# Altium schematic sheet Status LEDs.SchDoc
size A; SheetNumber: 2; SheetTotal: 3
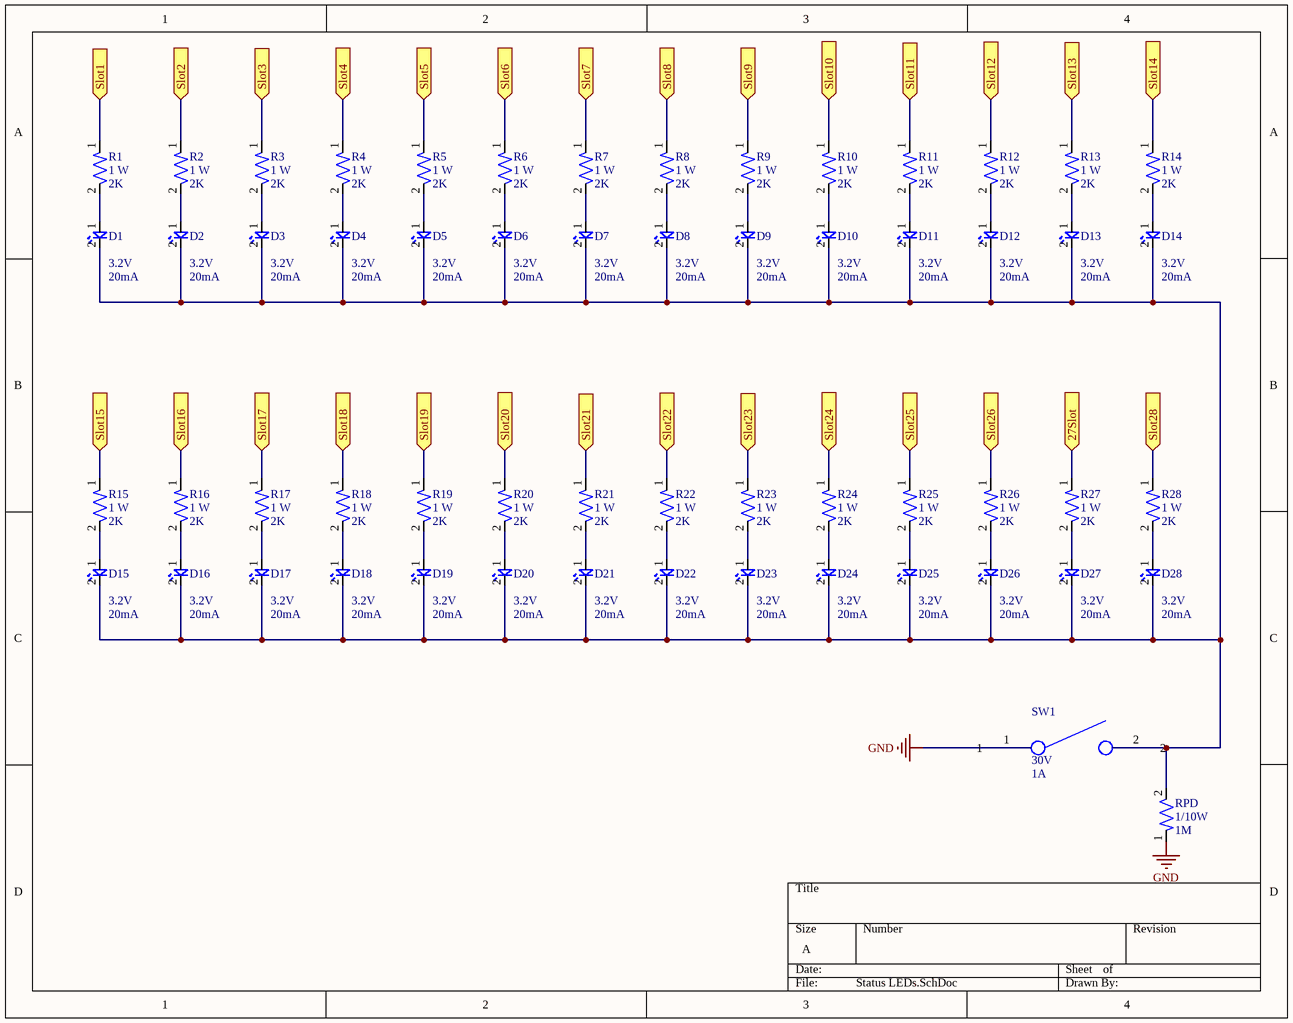
[diagram p0: Status LEDs.SchDoc]

## Parts
D1  Voltage: 3.2V  Current: 20mA  [WL-SMCW_0603]  (hidden comment: 150060GS75000)
D2  Voltage: 3.2V  Current: 20mA  [WL-SMCW_0603]  (hidden comment: 150060GS75000)
D3  Voltage: 3.2V  Current: 20mA  [WL-SMCW_0603]  (hidden comment: 150060GS75000)
D4  Voltage: 3.2V  Current: 20mA  [WL-SMCW_0603]  (hidden comment: 150060GS75000)
D5  Voltage: 3.2V  Current: 20mA  [WL-SMCW_0603]  (hidden comment: 150060GS75000)
D6  Voltage: 3.2V  Current: 20mA  [WL-SMCW_0603]  (hidden comment: 150060GS75000)
D7  Voltage: 3.2V  Current: 20mA  [WL-SMCW_0603]  (hidden comment: 150060GS75000)
D8  Voltage: 3.2V  Current: 20mA  [WL-SMCW_0603]  (hidden comment: 150060GS75000)
D9  Voltage: 3.2V  Current: 20mA  [WL-SMCW_0603]  (hidden comment: 150060GS75000)
D10  Voltage: 3.2V  Current: 20mA  [WL-SMCW_0603]  (hidden comment: 150060GS75000)
D11  Voltage: 3.2V  Current: 20mA  [WL-SMCW_0603]  (hidden comment: 150060GS75000)
D12  Voltage: 3.2V  Current: 20mA  [WL-SMCW_0603]  (hidden comment: 150060GS75000)
D13  Voltage: 3.2V  Current: 20mA  [WL-SMCW_0603]  (hidden comment: 150060GS75000)
D14  Voltage: 3.2V  Current: 20mA  [WL-SMCW_0603]  (hidden comment: 150060GS75000)
D15  Voltage: 3.2V  Current: 20mA  [WL-SMCW_0603]  (hidden comment: 150060GS75000)
D16  Voltage: 3.2V  Current: 20mA  [WL-SMCW_0603]  (hidden comment: 150060GS75000)
D17  Voltage: 3.2V  Current: 20mA  [WL-SMCW_0603]  (hidden comment: 150060GS75000)
D18  Voltage: 3.2V  Current: 20mA  [WL-SMCW_0603]  (hidden comment: 150060GS75000)
D19  Voltage: 3.2V  Current: 20mA  [WL-SMCW_0603]  (hidden comment: 150060GS75000)
D20  Voltage: 3.2V  Current: 20mA  [WL-SMCW_0603]  (hidden comment: 150060GS75000)
D21  Voltage: 3.2V  Current: 20mA  [WL-SMCW_0603]  (hidden comment: 150060GS75000)
D22  Voltage: 3.2V  Current: 20mA  [WL-SMCW_0603]  (hidden comment: 150060GS75000)
D23  Voltage: 3.2V  Current: 20mA  [WL-SMCW_0603]  (hidden comment: 150060GS75000)
D24  Voltage: 3.2V  Current: 20mA  [WL-SMCW_0603]  (hidden comment: 150060GS75000)
D25  Voltage: 3.2V  Current: 20mA  [WL-SMCW_0603]  (hidden comment: 150060GS75000)
D26  Voltage: 3.2V  Current: 20mA  [WL-SMCW_0603]  (hidden comment: 150060GS75000)
D27  Voltage: 3.2V  Current: 20mA  [WL-SMCW_0603]  (hidden comment: 150060GS75000)
D28  Voltage: 3.2V  Current: 20mA  [WL-SMCW_0603]  (hidden comment: 150060GS75000)
R1  Wattage: 1 W  Resistance: 2K  [RES-0805]  (hidden comment: RA73F2A2K0BTD)
R2  Wattage: 1 W  Resistance: 2K  [RES-0805]  (hidden comment: RA73F2A2K0BTD)
R3  Wattage: 1 W  Resistance: 2K  [RES-0805]  (hidden comment: RA73F2A2K0BTD)
R4  Wattage: 1 W  Resistance: 2K  [RES-0805]  (hidden comment: RA73F2A2K0BTD)
R5  Wattage: 1 W  Resistance: 2K  [RES-0805]  (hidden comment: RA73F2A2K0BTD)
R6  Wattage: 1 W  Resistance: 2K  [RES-0805]  (hidden comment: RA73F2A2K0BTD)
R7  Wattage: 1 W  Resistance: 2K  [RES-0805]  (hidden comment: RA73F2A2K0BTD)
R8  Wattage: 1 W  Resistance: 2K  [RES-0805]  (hidden comment: RA73F2A2K0BTD)
R9  Wattage: 1 W  Resistance: 2K  [RES-0805]  (hidden comment: RA73F2A2K0BTD)
R10  Wattage: 1 W  Resistance: 2K  [RES-0805]  (hidden comment: RA73F2A2K0BTD)
R11  Wattage: 1 W  Resistance: 2K  [RES-0805]  (hidden comment: RA73F2A2K0BTD)
R12  Wattage: 1 W  Resistance: 2K  [RES-0805]  (hidden comment: RA73F2A2K0BTD)
R13  Wattage: 1 W  Resistance: 2K  [RES-0805]  (hidden comment: RA73F2A2K0BTD)
R14  Wattage: 1 W  Resistance: 2K  [RES-0805]  (hidden comment: RA73F2A2K0BTD)
R15  Wattage: 1 W  Resistance: 2K  [RES-0805]  (hidden comment: RA73F2A2K0BTD)
R16  Wattage: 1 W  Resistance: 2K  [RES-0805]  (hidden comment: RA73F2A2K0BTD)
R17  Wattage: 1 W  Resistance: 2K  [RES-0805]  (hidden comment: RA73F2A2K0BTD)
R18  Wattage: 1 W  Resistance: 2K  [RES-0805]  (hidden comment: RA73F2A2K0BTD)
R19  Wattage: 1 W  Resistance: 2K  [RES-0805]  (hidden comment: RA73F2A2K0BTD)
R20  Wattage: 1 W  Resistance: 2K  [RES-0805]  (hidden comment: RA73F2A2K0BTD)
R21  Wattage: 1 W  Resistance: 2K  [RES-0805]  (hidden comment: RA73F2A2K0BTD)
R22  Wattage: 1 W  Resistance: 2K  [RES-0805]  (hidden comment: RA73F2A2K0BTD)
R23  Wattage: 1 W  Resistance: 2K  [RES-0805]  (hidden comment: RA73F2A2K0BTD)
R24  Wattage: 1 W  Resistance: 2K  [RES-0805]  (hidden comment: RA73F2A2K0BTD)
R25  Wattage: 1 W  Resistance: 2K  [RES-0805]  (hidden comment: RA73F2A2K0BTD)
R26  Wattage: 1 W  Resistance: 2K  [RES-0805]  (hidden comment: RA73F2A2K0BTD)
R27  Wattage: 1 W  Resistance: 2K  [RES-0805]  (hidden comment: RA73F2A2K0BTD)
R28  Wattage: 1 W  Resistance: 2K  [RES-0805]  (hidden comment: RA73F2A2K0BTD)
RPD  Wattage: 1/10W  Resistance: 1M  [RES-0603]  (hidden comment: RES 0603)
SW1  Voltage: 30V  Current: 1A  [BUTTON-0002]  (hidden comment: GPTS203211B)

## Ports
27Slot (in, see Power Distribution[4C]), Slot1 (in, see Power Distribution[1A]), Slot2 (in, see Power Distribution[1A]), Slot3 (in, see Power Distribution[1A]), Slot4 (in, see Power Distribution[2A]), Slot5 (in, see Power Distribution[2A]), Slot6 (in, see Power Distribution[2A]), Slot7 (in, see Power Distribution[2A]), Slot8 (in, see Power Distribution[3A]), Slot9 (in, see Power Distribution[3A]), Slot10 (in, see Power Distribution[3A]), Slot11 (in, see Power Distribution[3A]), Slot12 (in, see Power Distribution[4A]), Slot13 (in, see Power Distribution[4A]), Slot14 (in, see Power Distribution[4A]), Slot15 (in, see Power Distribution[1C]), Slot16 (in, see Power Distribution[1C]), Slot17 (in, see Power Distribution[1C]), Slot18 (in, see Power Distribution[2C]), Slot19 (in, see Power Distribution[2C]), Slot20 (in, see Power Distribution[2C]), Slot21 (in, see Power Distribution[2C]), Slot22 (in, see Power Distribution[3C]), Slot23 (in, see Power Distribution[3C]), Slot24 (in, see Power Distribution[3C]), Slot25 (in, see Power Distribution[3C]), Slot26 (in, see Power Distribution[4C]), Slot28 (in, see Power Distribution[4C])

## Nets
GND: RPD.1 SW1.1
27Slot: R27.1 ; port 27Slot
Slot1: R1.1 ; port Slot1
Slot2: R2.1 ; port Slot2
Slot3: R3.1 ; port Slot3
Slot4: R4.1 ; port Slot4
Slot5: R5.1 ; port Slot5
Slot6: R6.1 ; port Slot6
Slot7: R7.1 ; port Slot7
Slot8: R8.1 ; port Slot8
Slot9: R9.1 ; port Slot9
Slot10: R10.1 ; port Slot10
Slot11: R11.1 ; port Slot11
Slot12: R12.1 ; port Slot12
Slot13: R13.1 ; port Slot13
Slot14: R14.1 ; port Slot14
Slot15: R15.1 ; port Slot15
Slot16: R16.1 ; port Slot16
Slot17: R17.1 ; port Slot17
Slot18: R18.1 ; port Slot18
Slot19: R19.1 ; port Slot19
Slot20: R20.1 ; port Slot20
Slot21: R21.1 ; port Slot21
Slot22: R22.1 ; port Slot22
Slot23: R23.1 ; port Slot23
Slot24: R24.1 ; port Slot24
Slot25: R25.1 ; port Slot25
Slot26: R26.1 ; port Slot26
Slot28: R28.1 ; port Slot28
NetD1_1: D1.1 R1.2
NetD1_2: D1.2 D2.2 D3.2 D4.2 D5.2 D6.2 D7.2 D8.2 D9.2 D10.2 D11.2 D12.2 D13.2 D14.2 D15.2 D16.2 D17.2 D18.2 D19.2 D20.2 D21.2 D22.2 D23.2 D24.2 D25.2 D26.2 D27.2 D28.2 RPD.2 SW1.2
NetD2_1: D2.1 R2.2
NetD3_1: D3.1 R3.2
NetD4_1: D4.1 R4.2
NetD5_1: D5.1 R5.2
NetD6_1: D6.1 R6.2
NetD7_1: D7.1 R7.2
NetD8_1: D8.1 R8.2
NetD9_1: D9.1 R9.2
NetD10_1: D10.1 R10.2
NetD11_1: D11.1 R11.2
NetD12_1: D12.1 R12.2
NetD13_1: D13.1 R13.2
NetD14_1: D14.1 R14.2
NetD15_1: D15.1 R15.2
NetD16_1: D16.1 R16.2
NetD17_1: D17.1 R17.2
NetD18_1: D18.1 R18.2
NetD19_1: D19.1 R19.2
NetD20_1: D20.1 R20.2
NetD21_1: D21.1 R21.2
NetD22_1: D22.1 R22.2
NetD23_1: D23.1 R23.2
NetD24_1: D24.1 R24.2
NetD25_1: D25.1 R25.2
NetD26_1: D26.1 R26.2
NetD27_1: D27.1 R27.2
NetD28_1: D28.1 R28.2

## Library data of the parts
D1-D28 = LED-0002: Green 520nm LED Indication - Discrete 3.2V 0603 (1608 Metric)
R1-R28 = RES-2K-0001: 2 kOhms ±0.1% 1W Chip Resistor 0805 (2012 Metric) Thin Film
SW1 = BUTTON-0002: Pushbutton Switch SPST Standard Through Hole